# Altium schematic sheet Field_IO.SchDoc
size A4
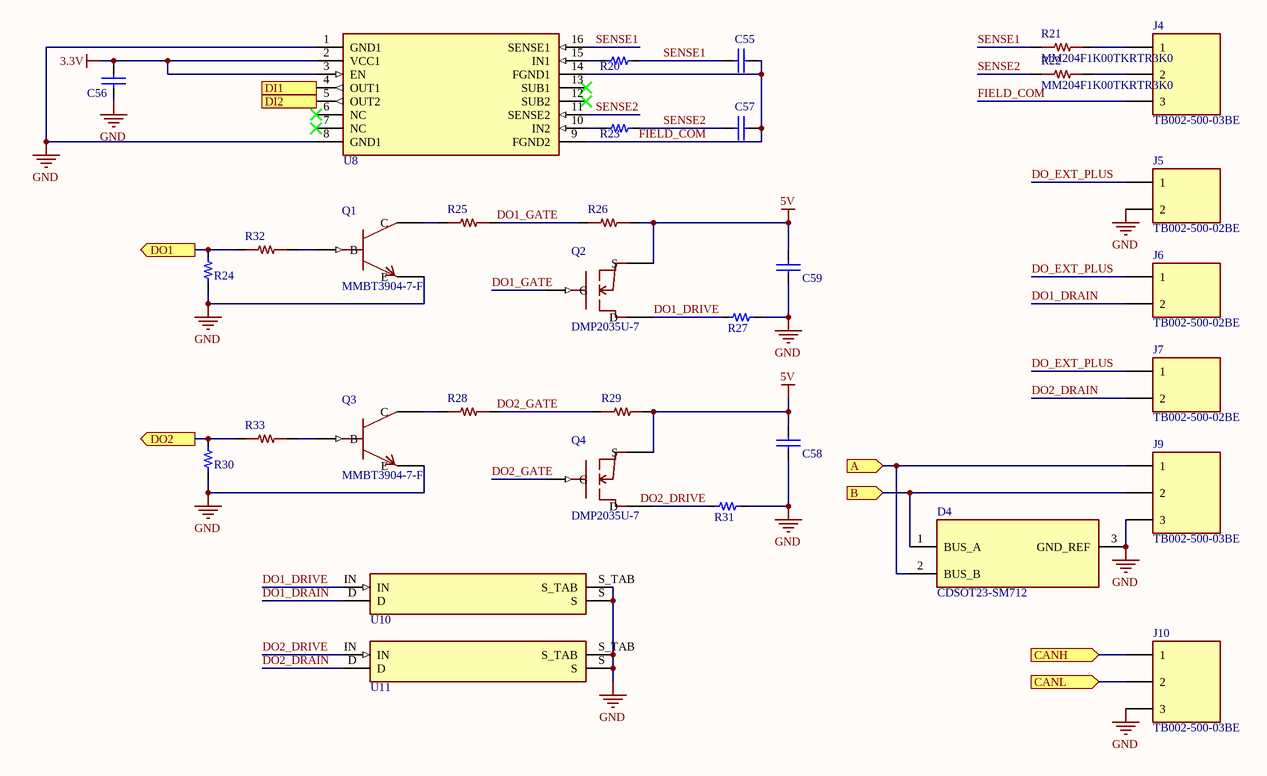
[diagram p0: Field_IO.SchDoc]

## Parts
C55  10 nF  [GW_0603_KEMET_NOMINAL]  (value not drawn)
C56  100 nF  [GW_0603_KEMET_NOMINAL]  (value not drawn)
C57  10 nF  [GW_0603_KEMET_NOMINAL]  (value not drawn)
C58  100 nF  [GW_0603_KEMET_NOMINAL]  (value not drawn)
C59  100 nF  [GW_0603_KEMET_NOMINAL]  (value not drawn)
D4  CDSOT23-SM712  [GW_SM712_BOURNS]
J4  TB002-500-03BE  [GW_TB002_500_3P_SAMESKY]
J5  TB002-500-02BE  [GW_TB002_500_2P_SAMESKY]
J6  TB002-500-02BE  [GW_TB002_500_2P_SAMESKY]
J7  TB002-500-02BE  [GW_TB002_500_2P_SAMESKY]
J9  TB002-500-03BE  [GW_TB002_500_3P_SAMESKY]
J10  TB002-500-03BE  [GW_TB002_500_3P_SAMESKY]
Q1  MMBT3904-7-F  [GW_MMBT3904_BEC_DIODES]
Q2  DMP2035U-7  [GW_DMP2035U_GSD_DIODES]
Q3  MMBT3904-7-F  [GW_MMBT3904_BEC_DIODES]
Q4  DMP2035U-7  [GW_DMP2035U_GSD_DIODES]
R20  562 Ohm  [GW_RC0603_YAGEO_REFLOW]  (value not drawn)
R21  MM204F1K00TKRTR3K0  [GW_MM204_FIRSTOHM]
R22  MM204F1K00TKRTR3K0  [GW_MM204_FIRSTOHM]
R23  562 Ohm  [GW_RC0603_YAGEO_REFLOW]  (value not drawn)
R24  10 kOhm  [GW_RC0603_YAGEO_REFLOW]  (value not drawn)
R25  RC0603FR-07100RL  [GW_RC0603_YAGEO_REFLOW]  (value not drawn)
R26  RC0603FR-074K7L  [GW_RC0603_YAGEO_REFLOW]  (value not drawn)
R27  2.49 kOhm  [GW_RC0603_YAGEO_REFLOW]  (value not drawn)
R28  RC0603FR-07100RL  [GW_RC0603_YAGEO_REFLOW]  (value not drawn)
R29  RC0603FR-074K7L  [GW_RC0603_YAGEO_REFLOW]  (value not drawn)
R30  10 kOhm  [GW_RC0603_YAGEO_REFLOW]  (value not drawn)
R31  2.49 kOhm  [GW_RC0603_YAGEO_REFLOW]  (value not drawn)
R32  RC0603FR-074K7L  [GW_RC0603_YAGEO_REFLOW]  (value not drawn)
R33  RC0603FR-074K7L  [GW_RC0603_YAGEO_REFLOW]  (value not drawn)
U8  ISO1212DBQR  [GW_DBQ0016A_TI]  (value not drawn)
U10  BSP75NTA  [GW_BSP75N_SOT223_DN_DIODES]  (value not drawn)
U11  BSP75NTA  [GW_BSP75N_SOT223_DN_DIODES]  (value not drawn)

## Ports
A (in), B (in), CANH (in), CANL (in), DI1 (out), DI2 (out), DO1 (out), DO2 (out)

## Nets
3.3V: C56.1 U8.2(VCC1) U8.3(EN)
5V: C58.1 C59.1 Q2.S Q4.S R26.2 R29.2
GND: C56.2 C58.2 C59.2 D4.3(GND_REF) J5.2 J9.3 J10.3 Q1.E Q3.E R24.1 R27.2 R30.1 R31.2 U8.1(GND1) U8.8(GND1) U10.S U10.S_TAB U11.S U11.S_TAB
A: D4.2(BUS_B) J9.1 ; port A
B: D4.1(BUS_A) J9.2 ; port B
CANH: J10.1 ; port CANH
CANL: J10.2 ; port CANL
DI1: U8.4(OUT1) ; port DI1
DI2: U8.5(OUT2) ; port DI2
DO1: R24.2 R32.1 ; port DO1
DO1_DRAIN: J6.2 U10.D
DO1_DRIVE: Q2.D R27.1 U10.IN
DO1_GATE: Q2.G R25.2 R26.1
DO2: R30.2 R33.1 ; port DO2
DO2_DRAIN: J7.2 U11.D
DO2_DRIVE: Q4.D R31.1 U11.IN
DO2_GATE: Q4.G R28.2 R29.1
DO_EXT_PLUS: J5.1 J6.1 J7.1
FIELD_COM: C55.2 C57.2 J4.3 U8.9(FGND2) U8.14(FGND1)
SENSE1: C55.1 R20.2 R21.1 U8.16(SENSE1)
SENSE2: C57.1 R22.1 R23.2 U8.11(SENSE2)
NetJ4_1: J4.1 R21.2
NetJ4_2: J4.2 R22.2
NetQ1_B: Q1.B R32.2
NetQ1_C: Q1.C R25.1
NetQ3_B: Q3.B R33.2
NetQ3_C: Q3.C R28.1
NetR20_1: R20.1 U8.15(IN1)
NetR23_1: R23.1 U8.10(IN2)

Not connected (* = marked no-connect by the designer): U8 6(NC)* 7(NC)* 12(SUB2)* 13(SUB1)*

## Library data of the parts
C55 C57 = GW_C0603C103K1RACTU_97f3ee33: C0603C103K1RACTU; 10 nF; 100 V; X7R; -55..125 C; CAD_CANDIDATE; Manufacturer: KEMET; Tolerance: 10%; Electrical_Status: PROVISIONAL; CAD_Source: Professor_shared.SchLib glyph Cap_0.1uF_0603_50V; CAD_Limitations: Glyph pins/types inspected; exact manufacturer land-pattern/mask/paste qualification pending.; Electrical_Notes: Ficha KEMET local DI_CIN p1; no confundir con externo CL10B103KA8WPNC 25 V. Modelo candidato existente; sin cotejo visual de pads/pines en Altium.; Manufacturer Part Number: C0603C103K1RACTU; Value: 10 nF; Rating: 100 V; X7R; -55..125 C; Power Rating: N/A; Package: 0603; CAD_Status: CAD_CANDIDATE
C56 C58 C59 = GW_C0603C104K5RACTU_dc5e12a5: C0603C104K5RACTU; 100 nF; 50 V; X7R; -55..125 C; CAD_CANDIDATE; Manufacturer: KEMET; Tolerance: 10%; Electrical_Status: PROVISIONAL; CAD_Source: Professor_shared.SchLib glyph Cap_0.1uF_0603_50V; CAD_Limitations: Glyph pins/types inspected; exact manufacturer land-pattern/mask/paste qualification pending.; Electrical_Notes: Ficha KEMET local p1. Adaptar parametros; no usar el Y5V 0603F104Z500CT como equivalente. Modelo candidato existente; sin cotejo visual de pads/pines en Altium.; Manufacturer Part Number: C0603C104K5RACTU; Value: 100 nF; Rating: 50 V; X7R; -55..125 C; Power Rating: N/A; Package: 0603; CAD_Status: CAD_CANDIDATE
D4 = CDSOT23-SM712: Bourns CDSOT23-SM712 saved2026-11-07 pp1-2 pin diagram and Recommended Footprint; CAD mapping supported; no transferred 1kV surge rating for THVD1420. Populate only after protection qualification.; CAD Status: CAD_CANDIDATE; Manufacturer: Bourns; Manufacturer Part Number: CDSOT23-SM712; Source: Bourns CDSOT23-SM712 saved2026-11-07 pp1-2 pin diagram and Recommended Footprint; Limitations: CAD mapping supported; no transferred 1kV surge rating for THVD1420. Populate only after protection qualification.
J4 J9 J10 = TB002-500-03BE: Same Sky TB002-500 Rev1.04 09/12/2024 p1 order key,p2 PCB layout; project contact1left in PCBtopview with wire entry facing-Y;not manufacturer polarity; Manufacturer: Same Sky (formerly CUI Devices); Value: 3-pole5mm terminal block; CAD Status: CAD_VERIFIED_GEOMETRY;NATIVE_PLACEMENT_PENDING; Electrical Status: DERIVED_PENDING_REVIEW; Physical Mapping: Project-defined1left then+X in PCBtopview; wire-entryfront-Y. Confirm wire polarity against silk before bringup.; Manufacturer Part Number: TB002-500-03BE; Source: Same Sky TB002-500 Rev1.04 09/12/2024 p1 order key,p2 PCB layout; Datasheet: sources/autonomous_closure/tb002-500.pdf
J5-J7 = TB002-500-02BE: Same Sky TB002-500 Rev1.04 09/12/2024 p1 order key,p2 PCB layout; project contact1left in PCBtopview with wire entry facing-Y;not manufacturer polarity; Manufacturer: Same Sky (formerly CUI Devices); Value: 2-pole5mm terminal block; CAD Status: CAD_VERIFIED_GEOMETRY;NATIVE_PLACEMENT_PENDING; Electrical Status: DERIVED_PENDING_REVIEW; Physical Mapping: Project-defined1left then+X in PCBtopview; wire-entryfront-Y. Confirm wire polarity against silk before bringup.; Manufacturer Part Number: TB002-500-02BE; Source: Same Sky TB002-500 Rev1.04 09/12/2024 p1 order key,p2 PCB layout; Datasheet: sources/autonomous_closure/tb002-500.pdf
Q1 Q3 = MMBT3904-7-F: Diodes DS30036 Rev27-2 March2025 p1 top view/order, p3 electrical, p6 suggested lands; conventional NPN symbol; used in5V BSP input driver,NOT24V load path; Manufacturer: Diodes Incorporated; Value: NPN 40V200mA; CAD Status: CAD_VERIFIED_GEOMETRY;NATIVE_PLACEMENT_PENDING; Electrical Status: DERIVED_PENDING_REVIEW; Manufacturer Part Number: MMBT3904-7-F; Source: Diodes DS30036 Rev27-2 March2025 p1 top view/order, p3 electrical, p6 suggested lands; Datasheet: sources/autonomous_closure/MMBT3904.pdf; Terminal Mapping: Top view tab/lead above C/D; lower-left B/G; lower-right E/S; manufacturer functional IDs, no guessed numbers
Q2 Q4 = DMP2035U-7: Diodes DS31830 Rev11-2 June2025 p1 top view/order,p2 electrical,p6 suggested lands; conventional PMOS symbol; used in5V BSP input driver,NOT24V load path; Manufacturer: Diodes Incorporated; Value: PMOS20V;VGS±10V; CAD Status: CAD_VERIFIED_GEOMETRY;NATIVE_PLACEMENT_PENDING; Electrical Status: DERIVED_PENDING_REVIEW; Manufacturer Part Number: DMP2035U-7; Source: Diodes DS31830 Rev11-2 June2025 p1 top view/order,p2 electrical,p6 suggested lands; Datasheet: sources/autonomous_closure/DMP2035U.pdf; Terminal Mapping: Top view tab/lead above C/D; lower-left B/G; lower-right E/S; manufacturer functional IDs, no guessed numbers
R20 R23 = GW_RC0603FR-07562RL_a6fad8df: RC0603FR-07562RL; 562 Ohm; 75 V max; limite sqrt(P*R); CAD_CANDIDATE; Manufacturer: Yageo; Tolerance: 1%; Power Rating: 0.1 W @70 C; Electrical_Status: PROVISIONAL; CAD_Source: Professor_shared.SchLib glyph Res_10k_0603_1/10W; CAD_Limitations: Glyph pins/types inspected; exact manufacturer land-pattern/mask/paste qualification pending.; Electrical_Notes: Ityp2.25mA; P conservadora a2.75mA=4.30mW. No es resistor de24V completos; corriente de campo separada deVCC1. Modelo candidato existente; sin cotejo visual de pads/pines en Altium.; Manufacturer Part Number: RC0603FR-07562RL; Value: 562 Ohm; Rating: 75 V max; limite sqrt(P*R); Package: 0603; CAD_Status: CAD_CANDIDATE
R21 R22 = MM204F1K00TKRTR3K0: MM204F1K00TKRTR3K0; CAD_VERIFIED_GEOMETRY; Saved1.3x1.6landsatx+/-1.45mmmatchmanufacturerreflowtable. Nonpolar1/2projectmappingverified. NormalDIType3applicationonly;no500V/1kVsurgequalificationinferredfromMELFor0.25W. NativeDIresistornetsmustbecorrected.; Manufacturer: Firstohm; CAD Status: CAD_CANDIDATE; Limitations: 1kOhm1%,0.25W@70C, normal Type3 operation supported. 500V/1kV system surge withstand NOT established.; Manufacturer Part Number: MM204F1K00TKRTR3K0; Source: Firstohm MM rev08-March-2023 printedpp75-78, p78 reflow pad table MM16/MM204
R24 R30 = GW_FRC0603J103TS_7289f91d: FRC0603J103TS; 10 kOhm; >= 3.3 V; tension de trabajo por verificar; CAD_CANDIDATE; Manufacturer: FOJAN; Tolerance: 5%; Power Rating: 0.1 W; Electrical_Status: PROVISIONAL; CAD_Source: Professor_shared.SchLib glyph Res_10k_0603_1/10W; CAD_Limitations: Glyph pins/types inspected; exact manufacturer land-pattern/mask/paste qualification pending.; Electrical_Notes: Ratings transcritos del CAD; falta ficha FOJAN. Alternativa RC0603FR-0710KL con ficha oficial local, mismo footprint candidato. Modelo candidato existente; sin cotejo visual de pads/pines en Altium.; Manufacturer Part Number: FRC0603J103TS; Value: 10 kOhm; Rating: >= 3.3 V; tension de trabajo por verificar; Package: 0603; CAD_Status: CAD_CANDIDATE
R25 R28 = RC0603FR-07100RL: RC0603FR-07100RL;1%0.1W75V0603; manufacturer RCseries ordering;Yageo mounting13Feb2018V10p4; Value: 100 Ohm; CAD Status: CAD_VERIFIED_GEOMETRY;NATIVE_PLACEMENT_PENDING; Electrical Status: DERIVED_PENDING_REVIEW;ORDER_CODE_FAMILY_SUPPORTED;EXACT_NOMINAL_SHEET_PENDING; Tolerance: 1%; Voltage Rating: 75V or sqrt(P*R),whichever lower; Power Rating: 0.1W at70C; Manufacturer: Yageo; Manufacturer Part Number: RC0603FR-07100RL; Source: Yageo RC0603 series order coding; Mounting13Feb2018V10 p4 Fig4/Table1; Package: 0603
R26 R29 R32 R33 = RC0603FR-074K7L: RC0603FR-074K7L;1%0.1W75V0603; manufacturer RCseries ordering;Yageo mounting13Feb2018V10p4; Value: 4.7 kOhm; CAD Status: CAD_VERIFIED_GEOMETRY;NATIVE_PLACEMENT_PENDING; Electrical Status: DERIVED_PENDING_REVIEW;ORDER_CODE_FAMILY_SUPPORTED;EXACT_NOMINAL_SHEET_PENDING; Tolerance: 1%; Voltage Rating: 75V or sqrt(P*R),whichever lower; Power Rating: 0.1W at70C; Manufacturer: Yageo; Manufacturer Part Number: RC0603FR-074K7L; Source: Yageo RC0603 series order coding; Mounting13Feb2018V10 p4 Fig4/Table1; Package: 0603
R27 R31 = GW_RC0603FR-072K49L_b905c5f0: RC0603FR-072K49L; 2.49 kOhm; 75 V max; limite sqrt(P*R); CAD_CANDIDATE; Manufacturer: Yageo; Tolerance: 1%; Power Rating: 0.1 W @70 C; CAD_Status: CAD_VERIFIED_SOURCE_LAND;NATIVE_INSTANCE_ECO_PENDING; Electrical_Status: PROVISIONAL; CAD_Source: Professor_shared.SchLib glyph Res_10k_0603_1/10W; CAD_Limitations: Same-manufacturer series mounting geometry verified; prototype mask/paste choices recorded. Electrical application limits unchanged. Native instance links/ECO pending.; Electrical_Notes: Candidato ENHANCED/RMII leader: ModeSelect NC, strap1=1 default, strap8=1, strap5=0 default. Ver tabla del informe; sin LEDs de straps. Modelo candidato existente; sin cotejo visual de pads/pines en Altium.; Manufacturer Part Number: RC0603FR-072K49L; Value: 2.49 kOhm; Rating: 75 V max; limite sqrt(P*R); Package: 0603
U8 = ISO1212DBQR: ISO1212DBQR; CAD_CANDIDATE; SUB12 and SUB13 must remain separate floating nets. TI recommends an individual 2x2mm floating copper island for each; these board-level islands are NOT encoded in this package footprint. Never join to either FGND, GND1 or each; Manufacturer: Texas Instruments; Electrical_Status: PROVISIONAL; CAD_Source: SLLSEY7G table4-2 p4; DBQ0016A 4214846/A PDF pp44-46; CAD_Limitations: SUB12 and SUB13 must remain separate floating nets. TI recommends an individual 2x2mm floating copper island for each; these board-level islands are NOT encoded in this package footprint. Never join to either FGND, GND1 or each other. NC6/7 unconnected.; Manufacturer Part Number: ISO1212DBQR; Value: ISO1212DBQR; CAD_Status: CAD_CANDIDATE
U10 U11 = BSP75NTA: BSP75NTA smart low-side switch; physical terminal positions and Diodes land pattern verified; IN,D,S,S_TAB identifiers; driver VOH acceptance remains pending.; Manufacturer: Diodes Incorporated; CAD_Status: CAD_BLOCKED; Electrical_Status: PROVISIONAL; CAD_Source: Diodes DS33016 Rev7-2 pp1,8; terminal numbering absent; CAD_Limitations: CAD_BLOCKED: terminal identifiers are role names, not manufacturer numbers. Tab=Source, isolated from Drain. Need exact numbered Type DN drawing/model before any placement or footprint binding.; CAD Status: CAD_VERIFIED; Limitations: Physical mapping verified from Diodes top view: with tab above, left IN, middle D, right S; tab S_TAB=Source. No manufacturer numeric pin IDs asserted. Loaded driver VOH and startup OFF not yet verified.; Electrical Approval: ELECTRICAL_BLOCKED_DRIVER_VOLTAGE_PENDING; Physical Mapping: IN left lower;D center lower;S right lower;S_TAB upper tab;Top View; Manufacturer Part Number: BSP75NTA; Value: BSP75NTA; Source: Diodes DS33016 Rev7-2 Jan2024 p1 Top View Pin Out, p8 Suggested Pad Layout; functional pad identifiers preserve original symbol pins; Datasheet: sources/bsp75n_closure/BSP75N.pdf